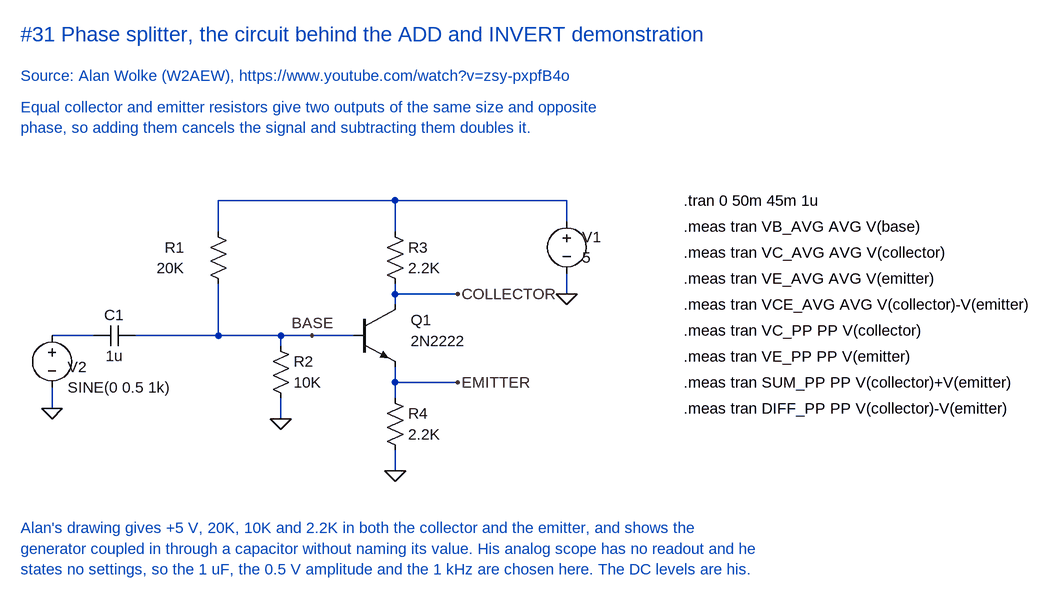
[diagram p0: schematic Phase splitter.asc]
Phase splitter.asc, the LTspice schematic file:
Version 4
SHEET 1 2000 1100
WIRE 464 256 736 256
WIRE 736 256 1000 256
WIRE 1000 256 1000 288
WIRE 1000 368 1000 400
WIRE 464 256 464 304
WIRE 464 384 464 464
WIRE 736 256 736 304
WIRE 736 384 736 400
WIRE 736 400 736 416
WIRE 736 400 832 400
WIRE 208 464 272 464
WIRE 336 464 464 464
WIRE 464 464 560 464
WIRE 560 464 672 464
WIRE 560 464 560 480
WIRE 560 560 560 592
WIRE 208 544 208 576
WIRE 736 512 736 536
WIRE 736 536 736 560
WIRE 736 536 832 536
WIRE 736 640 736 672
FLAG 1000 400 0
FLAG 208 576 0
FLAG 560 592 0
FLAG 736 672 0
FLAG 832 400 COLLECTOR
FLAG 832 536 EMITTER
FLAG 608 464 BASE
SYMBOL voltage 1000 272 R0
WINDOW 0 24 40 Left 2
WINDOW 3 24 72 Left 2
SYMATTR InstName V1
SYMATTR Value 5
SYMBOL voltage 208 448 R0
WINDOW 0 24 64 Left 2
WINDOW 3 24 96 Left 2
SYMATTR InstName V2
SYMATTR Value SINE(0 0.5 1k)
SYMBOL cap 336 448 R90
WINDOW 0 0 32 VBottom 2
WINDOW 3 32 32 VTop 2
SYMATTR InstName C1
SYMATTR Value 1u
SYMBOL res 448 288 R0
WINDOW 0 -36 40 Right 2
WINDOW 3 -36 72 Right 2
SYMATTR InstName R1
SYMATTR Value 20K
SYMBOL res 544 464 R0
WINDOW 0 36 40 Left 2
WINDOW 3 36 72 Left 2
SYMATTR InstName R2
SYMATTR Value 10K
SYMBOL res 720 288 R0
WINDOW 0 36 40 Left 2
WINDOW 3 36 72 Left 2
SYMATTR InstName R3
SYMATTR Value 2.2K
SYMBOL res 720 544 R0
WINDOW 0 36 40 Left 2
WINDOW 3 36 72 Left 2
SYMATTR InstName R4
SYMATTR Value 2.2K
SYMBOL npn 672 416 R0
WINDOW 0 88 24 Left 2
WINDOW 3 88 56 Left 2
SYMATTR InstName Q1
SYMATTR Value 2N2222
TEXT 160 0 Left 3 ;#31 Phase splitter, the circuit behind the ADD and INVERT demonstration
TEXT 160 64 Left 2 ;Source: Alan Wolke (W2AEW), https://www.youtube.com/watch?v=zsy-pxpfB4o
TEXT 160 112 Left 2 ;Equal collector and emitter resistors give two outputs of the same size and opposite
TEXT 160 144 Left 2 ;phase, so adding them cancels the signal and subtracting them doubles it.
TEXT 1180 256 Left 2 !.tran 0 50m 45m 1u
TEXT 1180 296 Left 2 !.meas tran VB_AVG AVG V(base)
TEXT 1180 336 Left 2 !.meas tran VC_AVG AVG V(collector)
TEXT 1180 376 Left 2 !.meas tran VE_AVG AVG V(emitter)
TEXT 1180 416 Left 2 !.meas tran VCE_AVG AVG V(collector)-V(emitter)
TEXT 1180 456 Left 2 !.meas tran VC_PP PP V(collector)
TEXT 1180 496 Left 2 !.meas tran VE_PP PP V(emitter)
TEXT 1180 536 Left 2 !.meas tran SUM_PP PP V(collector)+V(emitter)
TEXT 1180 576 Left 2 !.meas tran DIFF_PP PP V(collector)-V(emitter)
TEXT 160 760 Left 2 ;Alan's drawing gives +5 V, 20K, 10K and 2.2K in both the collector and the emitter, and shows the
TEXT 160 792 Left 2 ;generator coupled in through a capacitor without naming its value. His analog scope has no readout and he
TEXT 160 824 Left 2 ;states no settings, so the 1 uF, the 0.5 V amplitude and the 1 kHz are chosen here. The DC levels are his.

The netlist it stands for:
* Phase splitter.asc
V1 N001 0 5
V2 N002 0 SINE(0 0.5 1k)
C1 BASE N002 1u
R1 N001 BASE 20K
R2 BASE 0 10K
R3 N001 COLLECTOR 2.2K
R4 EMITTER 0 2.2K
Q1 COLLECTOR BASE EMITTER 0 2N2222
.model NPN NPN
.model PNP PNP
.lib standard.bjt
* #31 Phase splitter, the circuit behind the ADD and INVERT demonstration
* Source: Alan Wolke (W2AEW), https://www.youtube.com/watch?v=zsy-pxpfB4o
* Equal collector and emitter resistors give two outputs of the same size and opposite
* phase, so adding them cancels the signal and subtracting them doubles it.
.tran 0 50m 45m 1u
.meas tran VB_AVG AVG V(base)
.meas tran VC_AVG AVG V(collector)
.meas tran VE_AVG AVG V(emitter)
.meas tran VCE_AVG AVG V(collector)-V(emitter)
.meas tran VC_PP PP V(collector)
.meas tran VE_PP PP V(emitter)
.meas tran SUM_PP PP V(collector)+V(emitter)
.meas tran DIFF_PP PP V(collector)-V(emitter)
* Alan's drawing gives +5 V, 20K, 10K and 2.2K in both the collector and the emitter, and shows the
* generator coupled in through a capacitor without naming its value. His analog scope has no readout and he
* states no settings, so the 1 uF, the 0.5 V amplitude and the 1 kHz are chosen here. The DC levels are his.
.backanno
.end